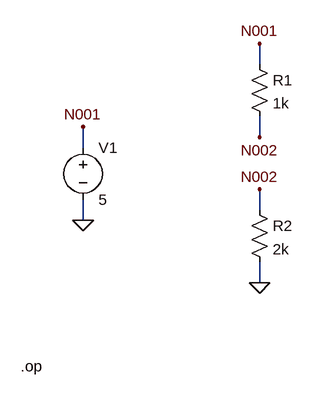
[diagram p0: schematic divider.asc]
divider.asc, the LTspice schematic file:
Version 4
SHEET 1 880 704
WIRE 160 288 160 320
WIRE 432 384 432 416
WIRE 160 208 160 176
WIRE 432 80 432 48
WIRE 432 160 432 192
WIRE 432 304 432 272
FLAG 160 320 0
FLAG 432 416 0
FLAG 160 176 N001
FLAG 432 48 N001
FLAG 432 192 N002
FLAG 432 272 N002
SYMBOL voltage 160 192 R0
SYMATTR InstName V1
SYMATTR Value 5
SYMBOL res 416 64 R0
SYMATTR InstName R1
SYMATTR Value 1k
SYMBOL res 416 288 R0
SYMATTR InstName R2
SYMATTR Value 2k
TEXT 64 544 Left 2 !.op

The netlist it stands for:
* divider.asc
V1 N001 0 5
R1 N001 N002 1k
R2 N002 0 2k
.op
.backanno
.end